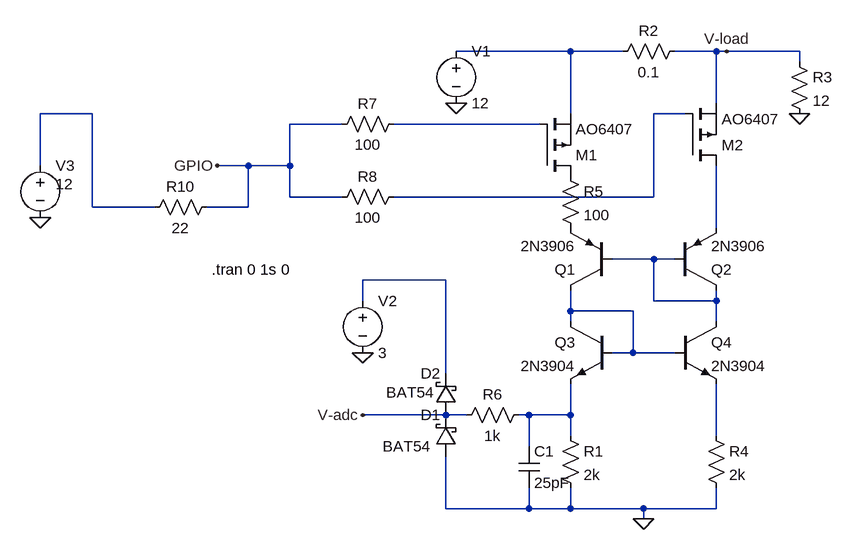
[diagram p0: schematic current_sense_pmosfet_control.asc]
current_sense_pmosfet_control.asc, the LTspice schematic file:
Version 4
SHEET 1 880 680
WIRE 96 -96 -80 -96
WIRE 176 -96 96 -96
WIRE 320 -96 256 -96
WIRE 336 -96 320 -96
WIRE 448 -96 336 -96
WIRE 448 -80 448 -96
WIRE 320 -16 320 -96
WIRE -640 0 -720 0
WIRE 96 0 96 -96
WIRE 272 0 224 0
WIRE -256 16 -336 16
WIRE 48 16 -176 16
WIRE -720 80 -720 0
WIRE -400 80 -448 80
WIRE -336 80 -336 16
WIRE -336 80 -400 80
WIRE -336 128 -336 80
WIRE -256 128 -336 128
WIRE 224 128 224 0
WIRE 224 128 -176 128
WIRE -640 144 -640 0
WIRE -544 144 -640 144
WIRE -400 144 -400 80
WIRE -400 144 -464 144
WIRE 320 176 320 80
WIRE 224 224 160 224
WIRE 256 224 224 224
WIRE -96 256 -224 256
WIRE -224 288 -224 256
WIRE 224 288 224 224
WIRE 320 288 320 272
WIRE 320 288 224 288
WIRE 96 304 96 272
WIRE 192 304 96 304
WIRE 96 320 96 304
WIRE 320 320 320 288
WIRE 192 368 192 304
WIRE 192 368 160 368
WIRE 256 368 192 368
WIRE -96 400 -96 256
WIRE -96 464 -224 464
WIRE -64 464 -96 464
WIRE 32 464 16 464
WIRE 96 464 96 416
WIRE 96 464 32 464
WIRE 96 496 96 464
WIRE 320 496 320 416
WIRE 32 512 32 464
WIRE -96 608 -96 528
WIRE 32 608 32 576
WIRE 32 608 -96 608
WIRE 96 608 96 576
WIRE 96 608 32 608
WIRE 208 608 96 608
WIRE 320 608 320 576
WIRE 320 608 208 608
WIRE 208 624 208 608
FLAG -80 -16 0
FLAG 448 0 0
FLAG 336 -96 V-load
FLAG -224 464 V-adc
FLAG 208 624 0
FLAG -224 368 0
FLAG -448 80 GPIO
FLAG -720 160 0
SYMBOL pnp 160 272 R180
SYMATTR InstName Q1
SYMATTR Value 2N3906
SYMBOL pnp 256 272 M180
SYMATTR InstName Q2
SYMATTR Value 2N3906
SYMBOL voltage -80 -112 R0
WINDOW 123 0 0 Left 0
WINDOW 39 0 0 Left 0
SYMATTR InstName V1
SYMATTR Value 12
SYMBOL res 272 -112 R90
WINDOW 0 0 56 VBottom 2
WINDOW 3 32 56 VTop 2
SYMATTR InstName R2
SYMATTR Value 0.1
SYMBOL res 432 -96 R0
SYMATTR InstName R3
SYMATTR Value 12
SYMBOL res 80 80 R0
SYMATTR InstName R5
SYMATTR Value 100
SYMBOL npn 160 320 M0
SYMATTR InstName Q3
SYMATTR Value 2N3904
SYMBOL npn 256 320 R0
SYMATTR InstName Q4
SYMATTR Value 2N3904
SYMBOL res 80 480 R0
SYMATTR InstName R1
SYMATTR Value 2k
SYMBOL res 304 480 R0
SYMATTR InstName R4
SYMATTR Value 2k
SYMBOL schottky -80 528 R180
WINDOW 0 24 64 Left 2
WINDOW 3 40 16 Left 2
SYMATTR InstName D1
SYMATTR Value BAT54
SYMATTR Description Zener Diode
SYMATTR Type zener
SYMBOL schottky -80 464 R180
WINDOW 0 24 64 Left 2
WINDOW 3 34 35 Left 2
SYMATTR InstName D2
SYMATTR Value BAT54
SYMATTR Description Zener Diode
SYMATTR Type zener
SYMBOL voltage -224 272 R0
WINDOW 123 0 0 Left 0
WINDOW 39 0 0 Left 0
SYMATTR InstName V2
SYMATTR Value 3
SYMBOL res 32 448 R90
WINDOW 0 0 56 VBottom 2
WINDOW 3 32 56 VTop 2
SYMATTR InstName R6
SYMATTR Value 1k
SYMBOL cap 16 512 R0
SYMATTR InstName C1
SYMATTR Value 25pF
SYMBOL pmos 48 96 M180
SYMATTR InstName M1
SYMATTR Value AO6407
SYMBOL pmos 272 80 M180
SYMATTR InstName M2
SYMATTR Value AO6407
SYMBOL res -160 0 R90
WINDOW 0 0 56 VBottom 2
WINDOW 3 32 56 VTop 2
SYMATTR InstName R7
SYMATTR Value 100
SYMBOL res -160 112 R90
WINDOW 0 0 56 VBottom 2
WINDOW 3 32 56 VTop 2
SYMATTR InstName R8
SYMATTR Value 100
SYMBOL voltage -720 64 R0
WINDOW 3 24 44 Left 2
WINDOW 123 0 0 Left 0
WINDOW 39 0 0 Left 0
SYMATTR InstName V3
SYMATTR Value 12
SYMBOL res -448 128 R90
WINDOW 0 0 56 VBottom 2
WINDOW 3 32 56 VTop 2
SYMATTR InstName R10
SYMATTR Value 22
TEXT -456 240 Left 2 !.tran 0 1s 0

The netlist it stands for:
* current_sense_pmosfet_control.asc
Q1 N008 N006 P001 0 2N3906
Q2 N006 N006 N005 0 2N3906
V1 N001 0 12
R2 V-load N001 0.1
R3 V-load 0 12
R5 P002 P001 100
Q3 N008 N008 N009 0 2N3904
Q4 N006 N008 N010 0 2N3904
R1 N009 0 2k
R4 N010 0 2k
D1 0 V-adc BAT54
D2 V-adc N007 BAT54
V2 N007 0 3
R6 N009 V-adc 1k
C1 N009 0 25pF
M1 P002 N004 N001 N001 AO6407
M2 N005 N003 V-load V-load AO6407
R7 N004 GPIO 100
R8 N003 GPIO 100
V3 N002 0 12
R10 GPIO N002 22
.model D D
.lib standard.dio
.model NPN NPN
.model PNP PNP
.lib standard.bjt
.model NMOS NMOS
.model PMOS PMOS
.lib standard.mos
.tran 0 1s 0
.backanno
.end